# Altium schematic sheet 06_50_RADAR_IO_CAN.SchDoc
size 289 x 396 mm
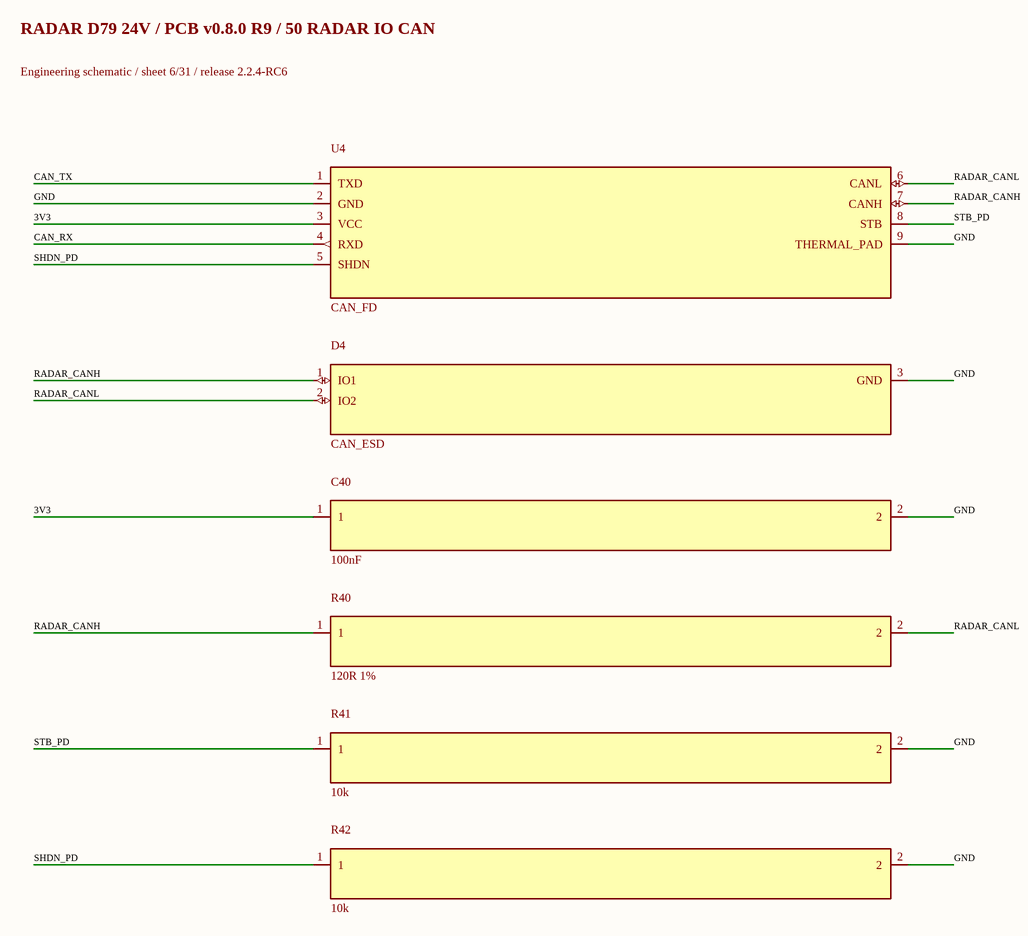
[diagram p0: 06_50_RADAR_IO_CAN.SchDoc]

## Parts
C40  100nF  [C_0402_1005Metric]
D4  CAN_ESD  [SOT-23]
R40  120R 1%  [R_0603_1608Metric]
R41  10k  [R_0603_1608Metric]
R42  10k  [R_0603_1608Metric]
U4  CAN_FD  [Texas_DRB0008A]

## Nets
3V3: C40.1 U4.3(VCC)
CAN_RX: U4.4(RXD)
CAN_TX: U4.1(TXD)
GND: C40.2 D4.3(GND) R41.2 R42.2 U4.2(GND) U4.9(THERMAL_PAD)
RADAR_CANH: D4.1(IO1) R40.1 U4.7(CANH)
RADAR_CANL: D4.2(IO2) R40.2 U4.6(CANL)
SHDN_PD: R42.1 U4.5(SHDN)
STB_PD: R41.1 U4.8(STB)

## Notes on the sheet
- RADAR D79 24V / PCB v0.8.0 R9 / 50 RADAR IO CAN
- Engineering schematic / sheet 6/31 / release 2.2.4-RC6